# Altium schematic sheet HouseLight_v0.SchDoc
size 320 x 180 mm; SheetNumber: 1; SheetTotal: 1
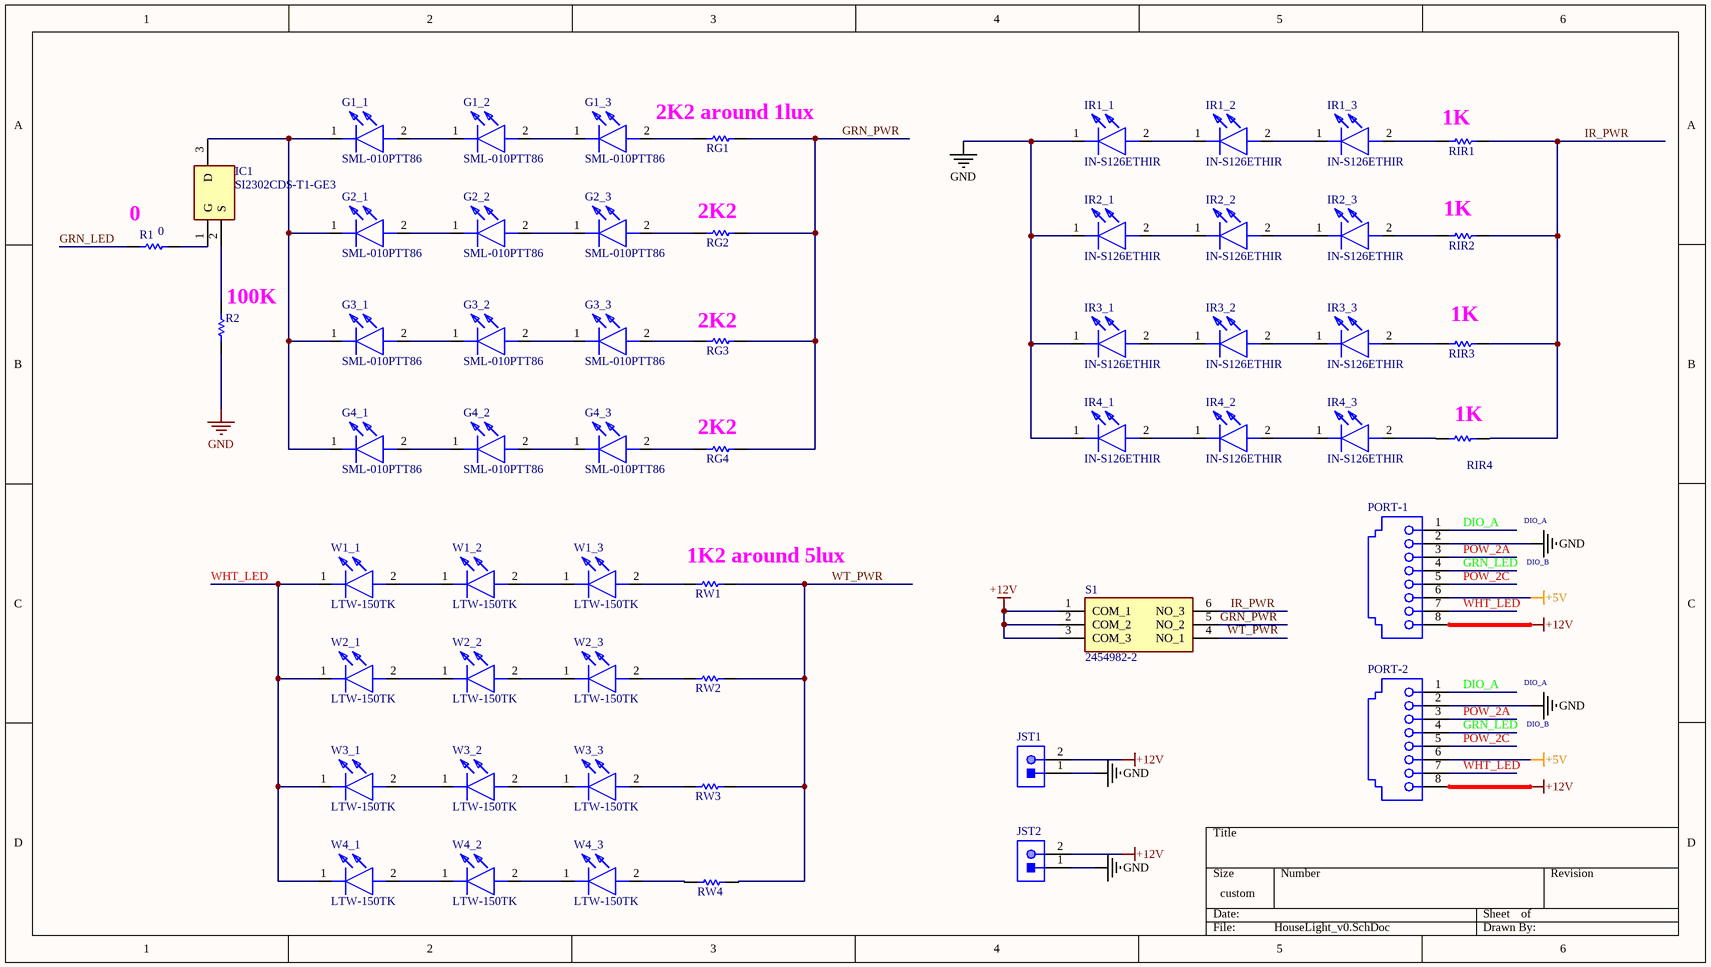
[diagram p0: HouseLight_v0.SchDoc]

## Parts
G1_1  SML-010PTT86  [SML010PTT86]
G1_2  SML-010PTT86  [SML010PTT86]
G1_3  SML-010PTT86  [SML010PTT86]
G2_1  SML-010PTT86  [SML010PTT86]
G2_2  SML-010PTT86  [SML010PTT86]
G2_3  SML-010PTT86  [SML010PTT86]
G3_1  SML-010PTT86  [SML010PTT86]
G3_2  SML-010PTT86  [SML010PTT86]
G3_3  SML-010PTT86  [SML010PTT86]
G4_1  SML-010PTT86  [SML010PTT86]
G4_2  SML-010PTT86  [SML010PTT86]
G4_3  SML-010PTT86  [SML010PTT86]
IC1  SI2302CDS-T1-GE3  [SOT96P237X111-3N]
IR1_1  IN-S126ETHIR  [SML010PTT86]
IR1_2  IN-S126ETHIR  [SML010PTT86]
IR1_3  IN-S126ETHIR  [SML010PTT86]
IR2_1  IN-S126ETHIR  [SML010PTT86]
IR2_2  IN-S126ETHIR  [SML010PTT86]
IR2_3  IN-S126ETHIR  [SML010PTT86]
IR3_1  IN-S126ETHIR  [SML010PTT86]
IR3_2  IN-S126ETHIR  [SML010PTT86]
IR3_3  IN-S126ETHIR  [SML010PTT86]
IR4_1  IN-S126ETHIR  [SML010PTT86]
IR4_2  IN-S126ETHIR  [SML010PTT86]
IR4_3  IN-S126ETHIR  [SML010PTT86]
JST1  S2B-PH-K-S(LF)(SN)  [JST-S2B-PH-K-S_V]  (value not drawn)
JST2  S2B-PH-K-S(LF)(SN)  [JST-S2B-PH-K-S_V]  (value not drawn)
PORT-1  215877-1  [615008138021]  (value not drawn)
PORT-2  215877-1  [615008138021]  (value not drawn)
R1  0  [0603R]
R2  100K  [0603R]  (value not drawn)
RG1  2K2  [0603R]  (value not drawn)
RG2  2K2  [0603R]  (value not drawn)
RG3  2K2  [0603R]  (value not drawn)
RG4  2K2  [0603R]  (value not drawn)
RIR1  1K3  [0603R]  (value not drawn)
RIR2  1K3  [0603R]  (value not drawn)
RIR3  1K3  [0603R]  (value not drawn)
RIR4  1K3  [0603R]  (value not drawn)
RW1  2K2  [0603R]  (value not drawn)
RW2  2K2  [0603R]  (value not drawn)
RW3  2K2  [0603R]  (value not drawn)
RW4  2K2  [0603R]  (value not drawn)
S1  2454982-2  [24549822]
W1_1  LTW-150TK  [SML010PTT86]
W1_2  LTW-150TK  [SML010PTT86]
W1_3  LTW-150TK  [SML010PTT86]
W2_1  LTW-150TK  [SML010PTT86]
W2_2  LTW-150TK  [SML010PTT86]
W2_3  LTW-150TK  [SML010PTT86]
W3_1  LTW-150TK  [SML010PTT86]
W3_2  LTW-150TK  [SML010PTT86]
W3_3  LTW-150TK  [SML010PTT86]
W4_1  LTW-150TK  [SML010PTT86]
W4_2  LTW-150TK  [SML010PTT86]
W4_3  LTW-150TK  [SML010PTT86]

## Nets
+5V: PORT-1.6 PORT-2.6
+12V: JST1.2 JST2.2 PORT-1.8 PORT-2.8 S1.1(COM_1) S1.2(COM_2) S1.3(COM_3)
GND: IR1_1.1(K) IR2_1.1(K) IR3_1.1(K) IR4_1.1(K) JST1.1 JST2.1 PORT-1.2 PORT-2.2 R2.2
DIO_A: PORT-1.1 PORT-2.1
GRN_LED: PORT-1.4 PORT-2.4 R1.2
GRN_PWR: RG1.2 RG2.2 RG3.2 RG4.2 S1.5(NO_2)
IR_PWR: RIR1.2 RIR2.2 RIR3.2 RIR4.2 S1.6(NO_3)
POW_2A: PORT-1.3 PORT-2.3
POW_2C: PORT-1.5 PORT-2.5
WHT_LED: PORT-1.7 PORT-2.7 W1_1.1(K) W2_1.1(K) W3_1.1(K) W4_1.1(K)
WT_PWR: RW1.2 RW2.2 RW3.2 RW4.2 S1.4(NO_1)
NetG1_1_1: G1_1.1(K) G2_1.1(K) G3_1.1(K) G4_1.1(K) IC1.3(D)
NetG1_1_2: G1_1.2(A) G1_2.1(K)
NetG1_2_2: G1_2.2(A) G1_3.1(K)
NetG1_3_2: G1_3.2(A) RG1.1
NetG2_1_2: G2_1.2(A) G2_2.1(K)
NetG2_2_2: G2_2.2(A) G2_3.1(K)
NetG2_3_2: G2_3.2(A) RG2.1
NetG3_1_2: G3_1.2(A) G3_2.1(K)
NetG3_2_2: G3_2.2(A) G3_3.1(K)
NetG3_3_2: G3_3.2(A) RG3.1
NetG4_1_2: G4_1.2(A) G4_2.1(K)
NetG4_2_2: G4_2.2(A) G4_3.1(K)
NetG4_3_2: G4_3.2(A) RG4.1
NetIC1_1: IC1.1(G) R1.1
NetIC1_2: IC1.2(S) R2.1
NetIR1_1_2: IR1_1.2(A) IR1_2.1(K)
NetIR1_2_2: IR1_2.2(A) IR1_3.1(K)
NetIR1_3_2: IR1_3.2(A) RIR1.1
NetIR2_1_2: IR2_1.2(A) IR2_2.1(K)
NetIR2_2_2: IR2_2.2(A) IR2_3.1(K)
NetIR2_3_2: IR2_3.2(A) RIR2.1
NetIR3_1_2: IR3_1.2(A) IR3_2.1(K)
NetIR3_2_2: IR3_2.2(A) IR3_3.1(K)
NetIR3_3_2: IR3_3.2(A) RIR3.1
NetIR4_1_2: IR4_1.2(A) IR4_2.1(K)
NetIR4_2_2: IR4_2.2(A) IR4_3.1(K)
NetIR4_3_2: IR4_3.2(A) RIR4.1
NetRW1_1: RW1.1 W1_3.2(A)
NetRW2_1: RW2.1 W2_3.2(A)
NetRW3_1: RW3.1 W3_3.2(A)
NetRW4_1: RW4.1 W4_3.2(A)
NetW1_1_2: W1_1.2(A) W1_2.1(K)
NetW1_2_2: W1_2.2(A) W1_3.1(K)
NetW2_1_2: W2_1.2(A) W2_2.1(K)
NetW2_2_2: W2_2.2(A) W2_3.1(K)
NetW3_1_2: W3_1.2(A) W3_2.1(K)
NetW3_2_2: W3_2.2(A) W3_3.1(K)
NetW4_1_2: W4_1.2(A) W4_2.1(K)
NetW4_2_2: W4_2.2(A) W4_3.1(K)

## Notes on the sheet
- 2K2 around 1lux
- (near RIR1) 1K
- (near R1) 0
- (near RG2) 2K2
- (near RIR2) 1K
- (near R2) 100K
- (near RG3) 2K2
- (near RIR3) 1K
- (near RG4) 2K2
- (near RIR4) 1K
- (near RW1) 1K2 around 5lux
- DIO_A
- DIO_B

## Library data of the parts
G1_1-G1_3 G2_1-G2_3 G3_1-G3_3 G4_1-G4_3 = SML-010PTT86: 2.2V 20mA 555nm 6.3mcd Emerald Green Water Clear SMD,3x2mm LED Indication - Discrete ROHS; Manufacturer_Name: ROHM Semiconductor; Datasheet Link: https://componentsearchengine.com/Datasheets/1/SML-010PTT86.pdf; Manufacturer_Part_Number: SML-010PTT86; Mouser Part Number: 755-SML-010PTT86; Mouser Price/Stock: https://www.mouser.co.uk/ProductDetail/ROHM-Semiconductor/SML-010PTT86?qs=4kLU8WoGk0sTbaHXE%252BLu9Q%3D%3D
IC1 = SI2302CDS-T1-GE3: 1 N-Channel 2.9A 20V 3.5nC@10V,4.5V 550mW 75mΩ@2.5V,3.1A 850mV@250uA N-Channel SOT-23 MOSFETs ROHS (C10488); Manufacturer_Name: Vishay; Datasheet Link: https://datasheet.datasheetarchive.com/originals/distributors/Datasheets-DGA23/1579559.pdf; Height: 1.12mm; Manufacturer_Part_Number: SI2302CDS-T1-GE3; Mouser Part Number: 781-SI2302CDS-T1-GE3; Mouser Price/Stock: https://www.mouser.co.uk/ProductDetail/Vishay-Semiconductors/SI2302CDS-T1-GE3?qs=IRuQNBqMOcmu69KRt6rZUQ%3D%3D; Arrow Part Number: SI2302CDS-T1-GE3; Arrow Price/Stock: https://www.arrow.com/en/products/si2302cds-t1-ge3/vishay?utm_currency=USD&region=europe
IR1_1-IR1_3 IR2_1-IR2_3 IR3_1-IR3_3 IR4_1-IR4_3 = SML-010PTT86: -40℃~+85℃ 1.2V 30° 5mW/sr@20mA 940nm 1206 Infrared LED Emitters ROHS (C6639616); Manufacturer_Name: ROHM Semiconductor; Datasheet Link: https://componentsearchengine.com/Datasheets/1/SML-010PTT86.pdf; Manufacturer_Part_Number: SML-010PTT86; Mouser Part Number: 755-SML-010PTT86; Mouser Price/Stock: https://www.mouser.co.uk/ProductDetail/ROHM-Semiconductor/SML-010PTT86?qs=4kLU8WoGk0sTbaHXE%252BLu9Q%3D%3D
JST1 JST2 = CMP-1755-00004-1: -25℃~+85℃ 1 100V 1x2P 2 2A 2P 2mm 4.8mm 5.9mm 7.6mm Brass K Pin PA66 PH Right Angle Tin UL94V-0 White Push-Pull,P=2mm Wire To Board Connector ROHS (C173752); Case\Package: Radial; Tolerance: 20%; Capacitance: 10 uF; Voltage Rating (DC): 50 V; Packaging: Bulk; ComponentLink1URL: http://www.jst-mfg.com/product/pdf/eng/ePH.pdf; Radiation Hardening: No; Height: 11 mm; Package Quantity: 200; PackageDescription: Male Header, Pitch 2 mm, 1 x 2 Position, Height 4.8 mm, Tail Length 3.4 mm; PackageReference: S2B-PH-K-S; Diameter: 5 mm; Pins: 2; Mount: Through Hole; Max Operating Temperature: 85 degC; Min Operating Temperature: -40 degC; ComponentLink1Description: Datasheet; DatasheetVersion: Dec-12; Length: 11 mm; Lead Pitch: 2 mm; REACH SVHC: No SVHC; Voltage Rating: 50 V; RoHSCompliant: true
PORT-1 PORT-2 = CMP-1502-01725-1: -40℃~+70℃ 1 Gold Non-LED Phosphor Bronze RJ45 Jack Unshielded cat3 Plugin Ethernet Connectors / Modular Connectors (RJ45 RJ11) ROHS (C305919); Manufacturer: Wurth Elektronik; Entrance: Vertical; Withstanding Voltage: 1000VAC; Contact Resistance: 20mOhm; Port: 1x1; Pin Number: 8P8C; Working Voltage: 120VAC; Rated Current: 1.5A; Compliance: Leadfree/RoHS; Publisher: WurthElektronik; Datasheet URL: https://katalog.we-online.de/em/datasheet/615008138021.pdf; Part Number: 615008138021; Manufacturer URL: http://www.we-online.de; Mounting Technology: THT; Operating Temperature: -40to85degC; Package Reference: 615008138021; Packaging: Tray
R1 = Res_12K1_1%_0603: -55℃~+155℃ 100kΩ 100mW 75V Thick Film Resistor ±1% ±100ppm/℃ 0603 Chip Resistor - Surface Mount ROHS (C14675); Manuf_Part_1: MCT 0603-50 1% P5 12K1; Manuf_1: VISHAY; Value: 12K1; Order: 2325243; ECCN_US/EU: n/a; Distrib: FARNELL
R2 = Res_12K1_1%_0603: -55℃~+155℃ 100mW 100kΩ 75V Thick Film Resistor ±1% ±100ppm/℃ 0603 Chip Resistor - Surface Mount ROHS; Manuf_Part_1: MCT 0603-50 1% P5 12K1; Manuf_1: VISHAY; Value: 12K1; Order: 2325243; ECCN_US/EU: n/a; Distrib: FARNELL
RG1-RG4 RIR1-RIR4 RW1-RW4 = Res_12K1_1%_0603: -55℃~+155℃ 100mW 2.2kΩ 75V Thick Film Resistor ±1% ±100ppm/℃ 0603 Chip Resistor - Surface Mount ROHS (C309562); Manuf_Part_1: MCT 0603-50 1% P5 12K1; Manuf_1: VISHAY; Value: 12K1; Order: 2325243; ECCN_US/EU: n/a; Distrib: FARNELL
S1 = 2454982-2: Switch; Manufacturer_Name: TE Connectivity; Datasheet Link: https://www.mouser.com/datasheet/2/418/3/NG_CS_1308111-1_SWITCHES_CORE_PROGRAM_CATALOG_0308-1234892.pdf; Height: 4.51mm; Manufacturer_Part_Number: 2454982-2; Mouser Part Number: 655-2454982-2; Mouser Price/Stock: https://www.mouser.co.uk/ProductDetail/TE-Connectivity-Alcoswitch/2454982-2?qs=1Kr7Jg1SGW%2FyvNyTL9wDrw%3D%3D; Arrow Part Number: 2454982-2; Arrow Price/Stock: https://www.arrow.com/en/products/2454982-2/te-connectivity?region=nac
W1_1-W1_3 W2_1-W2_3 W3_1-W3_3 W4_1-W4_3 = SML-010PTT86: -20℃~+80℃ 130° 20mA 260mcd 3.2V 70mW Discrete Diode White Yellow Lens 1206 LED Indication - Discrete ROHS (C133134); Manufacturer_Name: ROHM Semiconductor; Datasheet Link: https://componentsearchengine.com/Datasheets/1/SML-010PTT86.pdf; Manufacturer_Part_Number: SML-010PTT86; Mouser Part Number: 755-SML-010PTT86; Mouser Price/Stock: https://www.mouser.co.uk/ProductDetail/ROHM-Semiconductor/SML-010PTT86?qs=4kLU8WoGk0sTbaHXE%252BLu9Q%3D%3D